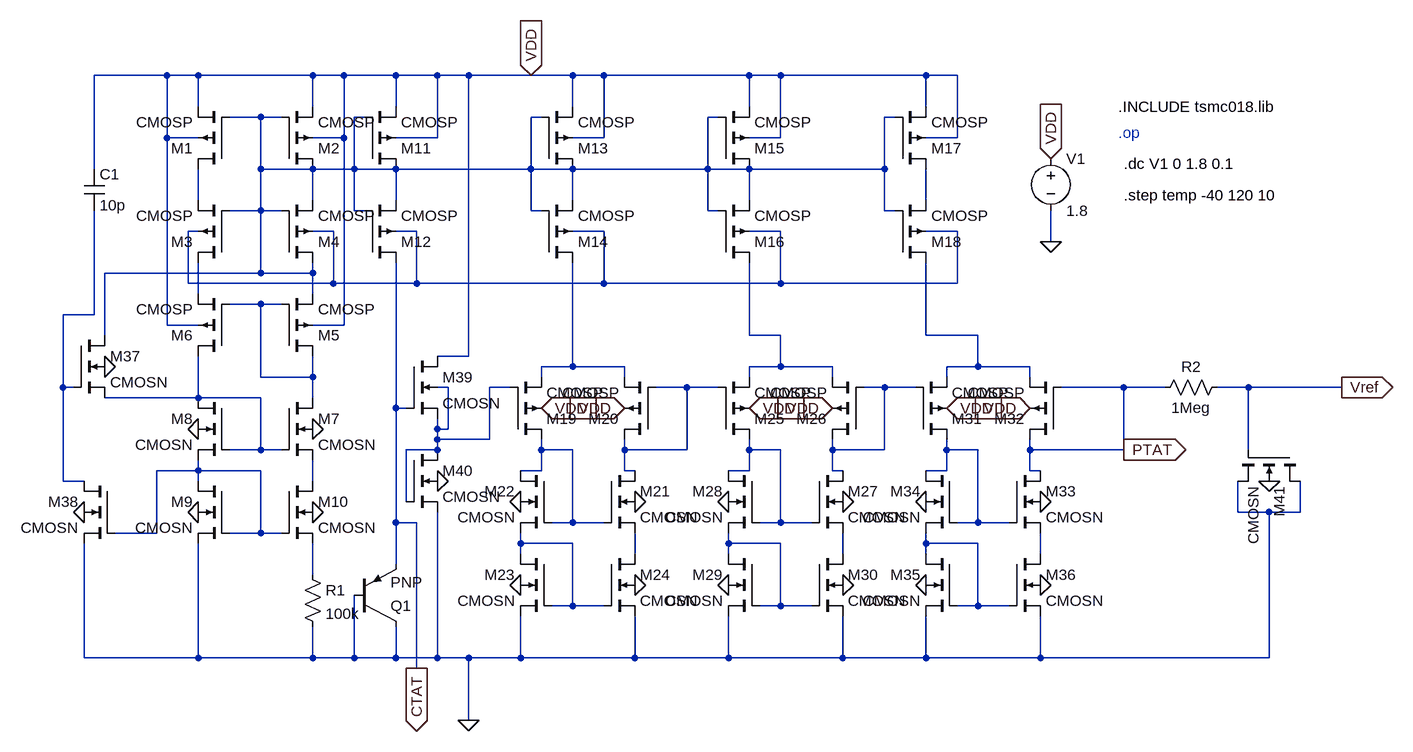
[diagram p0: schematic Bgr_Task2.asc]
Bgr_Task2.asc, the LTspice schematic file:
Version 4.1
SHEET 1 1916 1032
WIRE 0 0 -112 0
WIRE 48 0 0 0
WIRE 224 0 48 0
WIRE 272 0 224 0
WIRE 352 0 272 0
WIRE 416 0 352 0
WIRE 464 0 416 0
WIRE 560 0 464 0
WIRE 624 0 560 0
WIRE 672 0 624 0
WIRE 896 0 672 0
WIRE 944 0 896 0
WIRE 1168 0 944 0
WIRE 1216 0 1168 0
WIRE 48 48 48 0
WIRE 224 48 224 0
WIRE 352 48 352 0
WIRE 624 48 624 0
WIRE 896 48 896 0
WIRE 1168 48 1168 0
WIRE 144 64 96 64
WIRE 176 64 144 64
WIRE 304 64 288 64
WIRE 576 64 560 64
WIRE 848 64 832 64
WIRE 1120 64 1104 64
WIRE 0 96 0 0
WIRE 48 96 0 96
WIRE 272 96 272 0
WIRE 272 96 224 96
WIRE 416 96 416 0
WIRE 416 96 352 96
WIRE 672 96 672 0
WIRE 672 96 624 96
WIRE 944 96 944 0
WIRE 944 96 896 96
WIRE 1216 96 1216 0
WIRE 1216 96 1168 96
WIRE -112 144 -112 0
WIRE 144 144 144 64
WIRE 224 144 144 144
WIRE 288 144 288 64
WIRE 288 144 224 144
WIRE 352 144 288 144
WIRE 560 144 560 64
WIRE 560 144 352 144
WIRE 624 144 560 144
WIRE 832 144 832 64
WIRE 832 144 624 144
WIRE 896 144 832 144
WIRE 1104 144 1104 64
WIRE 1104 144 896 144
WIRE 48 192 48 144
WIRE 224 192 224 144
WIRE 352 192 352 144
WIRE 624 192 624 144
WIRE 896 192 896 144
WIRE 1168 192 1168 144
WIRE 144 208 144 144
WIRE 144 208 96 208
WIRE 176 208 144 208
WIRE 288 208 288 144
WIRE 304 208 288 208
WIRE 560 208 560 144
WIRE 576 208 560 208
WIRE 832 208 832 144
WIRE 848 208 832 208
WIRE 1104 208 1104 144
WIRE 1120 208 1104 208
WIRE 48 240 32 240
WIRE 256 240 224 240
WIRE 384 240 352 240
WIRE 672 240 624 240
WIRE 944 240 896 240
WIRE 1216 240 1168 240
WIRE 1360 256 1360 208
WIRE 144 304 144 208
WIRE 144 304 -96 304
WIRE 224 304 224 288
WIRE 224 304 144 304
WIRE 32 320 32 240
WIRE 256 320 256 240
WIRE 256 320 32 320
WIRE 384 320 384 240
WIRE 384 320 256 320
WIRE 672 320 672 240
WIRE 672 320 384 320
WIRE 944 320 944 240
WIRE 944 320 672 320
WIRE 1216 320 1216 240
WIRE 1216 320 944 320
WIRE 48 336 48 288
WIRE 224 336 224 304
WIRE 144 352 96 352
WIRE 176 352 144 352
WIRE -112 368 -112 208
WIRE -112 368 -160 368
WIRE 0 384 0 96
WIRE 48 384 0 384
WIRE 272 384 272 96
WIRE 272 384 224 384
WIRE -96 400 -96 304
WIRE 896 400 896 288
WIRE 944 400 896 400
WIRE 1168 400 1168 288
WIRE 1248 400 1168 400
WIRE 464 432 464 0
WIRE 464 432 416 432
WIRE 624 448 624 288
WIRE 624 448 576 448
WIRE 704 448 624 448
WIRE 944 448 944 400
WIRE 944 448 896 448
WIRE 1024 448 944 448
WIRE 1248 448 1248 400
WIRE 1248 448 1200 448
WIRE 1328 448 1248 448
WIRE 144 464 144 352
WIRE 224 464 224 432
WIRE 224 464 144 464
WIRE 576 464 576 448
WIRE 704 464 704 448
WIRE 896 464 896 448
WIRE 1024 464 1024 448
WIRE 1200 464 1200 448
WIRE 1328 464 1328 448
WIRE -160 480 -160 368
WIRE -144 480 -160 480
WIRE 432 480 416 480
WIRE 528 480 496 480
WIRE 800 480 752 480
WIRE 848 480 800 480
WIRE 1104 480 1072 480
WIRE 1152 480 1104 480
WIRE 1472 480 1376 480
WIRE 1536 480 1472 480
WIRE 1664 480 1616 480
WIRE 1808 480 1664 480
WIRE 48 496 48 432
WIRE 48 496 -96 496
WIRE 144 496 48 496
WIRE 224 496 224 464
WIRE 352 512 352 288
WIRE 368 512 352 512
WIRE 416 544 416 528
WIRE 432 544 432 480
WIRE 432 544 416 544
WIRE 416 560 416 544
WIRE 496 560 496 480
WIRE 496 560 416 560
WIRE 144 576 144 496
WIRE 144 576 96 576
WIRE 176 576 144 576
WIRE 416 576 416 560
WIRE 416 576 368 576
WIRE 576 576 576 560
WIRE 624 576 576 576
WIRE 704 576 704 560
WIRE 800 576 800 480
WIRE 800 576 704 576
WIRE 896 576 896 560
WIRE 944 576 896 576
WIRE 1024 576 1024 560
WIRE 1104 576 1104 480
WIRE 1104 576 1024 576
WIRE 1200 576 1200 560
WIRE 1248 576 1200 576
WIRE 1328 576 1328 560
WIRE 1472 576 1472 480
WIRE 1472 576 1328 576
WIRE 1664 576 1664 480
WIRE 48 608 48 592
WIRE 48 608 -16 608
WIRE 144 608 48 608
WIRE 576 608 576 576
WIRE 576 608 544 608
WIRE 704 608 704 576
WIRE 720 608 704 608
WIRE 896 608 896 576
WIRE 896 608 864 608
WIRE 1024 608 1024 576
WIRE 1040 608 1024 608
WIRE 1200 608 1200 576
WIRE 1200 608 1168 608
WIRE 1328 608 1328 576
WIRE 1344 608 1328 608
WIRE -160 624 -160 480
WIRE -128 624 -160 624
WIRE 48 624 48 608
WIRE 224 624 224 592
WIRE 368 656 368 576
WIRE 1648 672 1648 624
WIRE 1696 672 1648 672
WIRE 1744 672 1744 624
WIRE 1744 672 1696 672
WIRE 352 688 352 512
WIRE 384 688 352 688
WIRE 624 688 624 576
WIRE 624 688 592 688
WIRE 672 688 624 688
WIRE 944 688 944 576
WIRE 944 688 912 688
WIRE 992 688 944 688
WIRE 1248 688 1248 576
WIRE 1248 688 1216 688
WIRE 1296 688 1248 688
WIRE -16 704 -16 608
WIRE -16 704 -80 704
WIRE 144 704 144 608
WIRE 144 704 96 704
WIRE 176 704 144 704
WIRE 544 720 544 704
WIRE 624 720 544 720
WIRE 864 720 864 704
WIRE 944 720 864 720
WIRE 1168 720 1168 704
WIRE 1248 720 1168 720
WIRE 544 736 544 720
WIRE 720 736 720 704
WIRE 864 736 864 720
WIRE 1040 736 1040 704
WIRE 1168 736 1168 720
WIRE 1344 736 1344 704
WIRE 352 752 352 688
WIRE 224 768 224 720
WIRE 624 816 624 720
WIRE 624 816 592 816
WIRE 672 816 624 816
WIRE 944 816 944 720
WIRE 944 816 912 816
WIRE 992 816 944 816
WIRE 1248 816 1248 720
WIRE 1248 816 1216 816
WIRE 1296 816 1248 816
WIRE -128 896 -128 720
WIRE 48 896 48 720
WIRE 48 896 -128 896
WIRE 224 896 224 848
WIRE 224 896 48 896
WIRE 288 896 288 800
WIRE 288 896 224 896
WIRE 352 896 352 848
WIRE 352 896 288 896
WIRE 416 896 416 672
WIRE 416 896 352 896
WIRE 464 896 416 896
WIRE 544 896 544 832
WIRE 544 896 464 896
WIRE 720 896 720 832
WIRE 720 896 544 896
WIRE 864 896 864 832
WIRE 864 896 720 896
WIRE 1040 896 1040 832
WIRE 1040 896 864 896
WIRE 1168 896 1168 832
WIRE 1168 896 1040 896
WIRE 1344 896 1344 832
WIRE 1344 896 1168 896
WIRE 1696 896 1696 672
WIRE 1696 896 1344 896
WIRE 384 912 384 688
WIRE 464 992 464 896
FLAG 1360 256 0
FLAG 1360 128 VDD
IOPIN 1360 128 In
FLAG 464 992 0
FLAG 560 0 VDD
IOPIN 560 0 In
FLAG 1808 480 Vref
IOPIN 1808 480 Out
FLAG 576 512 VDD
IOPIN 576 512 In
FLAG 704 512 VDD
IOPIN 704 512 In
FLAG 896 512 VDD
IOPIN 896 512 In
FLAG 1024 512 VDD
IOPIN 1024 512 In
FLAG 1200 512 VDD
IOPIN 1200 512 In
FLAG 1328 512 VDD
IOPIN 1328 512 In
FLAG 416 624 0
FLAG 544 656 0
FLAG 720 656 0
FLAG 544 784 0
FLAG 720 784 0
FLAG 864 784 0
FLAG 864 656 0
FLAG 1040 656 0
FLAG 1040 784 0
FLAG 1168 656 0
FLAG 1344 656 0
FLAG 1344 784 0
FLAG 1168 784 0
FLAG 48 672 0
FLAG 48 544 0
FLAG 224 544 0
FLAG 224 672 0
FLAG -128 672 0
FLAG -96 448 0
FLAG 1696 624 0
FLAG 384 912 CTAT
IOPIN 384 912 Out
FLAG 1472 576 PTAT
IOPIN 1472 576 Out
DATAFLAG 384 752 ""
SYMBOL cmosp 96 144 R180
SYMATTR InstName M1
SYMATTR Value2 l=4u w=8u
SYMBOL cmosp 176 144 M180
SYMATTR InstName M2
SYMATTR Value2 l=4u w=8u
SYMBOL cmosp 96 288 R180
SYMATTR InstName M3
SYMATTR Value2 l=4u w=8u
SYMBOL cmosp 176 288 M180
SYMATTR InstName M4
SYMATTR Value2 l=4u w=8u
SYMBOL cmosp 176 432 M180
SYMATTR InstName M5
SYMATTR Value2 l=4u w=8u
SYMBOL cmosp 96 432 R180
SYMATTR InstName M6
SYMATTR Value2 l=4u w=8u
SYMBOL cmosn 176 496 R0
SYMATTR InstName M7
SYMATTR Value2 l=4u w=4u
SYMBOL cmosn 96 496 M0
SYMATTR InstName M8
SYMATTR Value2 l=4u w=4u
SYMBOL cmosn 96 624 M0
SYMATTR InstName M9
SYMATTR Value2 l=4u w=4u
SYMBOL cmosn 176 624 R0
SYMATTR InstName M10
SYMATTR Value2 l=4u w=4u
SYMBOL voltage 1360 112 R0
WINDOW 123 0 0 Left 0
WINDOW 39 0 0 Left 0
SYMATTR InstName V1
SYMATTR Value 1.8
SYMBOL cmosp 304 144 M180
SYMATTR InstName M11
SYMATTR Value2 l=2u w=20u
SYMBOL cmosp 304 288 M180
SYMATTR InstName M12
SYMATTR Value2 l=2u w=20u
SYMBOL cmosp 576 144 M180
SYMATTR InstName M13
SYMATTR Value2 l=2u w=20u
SYMBOL cmosp 576 288 M180
SYMATTR InstName M14
SYMATTR Value2 l=2u w=20u
SYMBOL cmosp 848 144 M180
SYMATTR InstName M15
SYMATTR Value2 l=2u w=20u
SYMBOL cmosp 848 288 M180
SYMATTR InstName M16
SYMATTR Value2 l=2u w=20u
SYMBOL cmosp 1120 144 M180
SYMATTR InstName M17
SYMATTR Value2 l=2u w=20u
SYMBOL cmosp 1120 288 M180
SYMATTR InstName M18
SYMATTR Value2 l=2u w=20u
SYMBOL cmosp 528 560 M180
SYMATTR InstName M19
SYMATTR Value2 l=2u w=1u
SYMBOL cmosp 752 560 R180
SYMATTR InstName M20
SYMATTR Value2 l=2u w=40u
SYMBOL cmosn 672 608 R0
SYMATTR InstName M21
SYMATTR Value2 l=2u w=10u
SYMBOL cmosn 592 608 M0
SYMATTR InstName M22
SYMATTR Value2 l=2u w=10u
SYMBOL cmosn 592 736 M0
SYMATTR InstName M23
SYMATTR Value2 l=2u w=10u
SYMBOL cmosn 672 736 R0
SYMATTR InstName M24
SYMATTR Value2 l=2u w=10u
SYMBOL cmosn -144 400 R0
SYMATTR InstName M37
SYMATTR Value2 l=2u w=4u
SYMBOL cmosn -80 624 M0
SYMATTR InstName M38
SYMATTR Value2 l=2u w=4u
SYMBOL cap -128 144 R0
SYMATTR InstName C1
SYMATTR Value 10p
SYMBOL res 208 752 R0
SYMATTR InstName R1
SYMATTR Value 100k
SYMBOL pnp 288 848 M180
SYMATTR InstName Q1
SYMBOL cmosn 368 432 R0
SYMATTR InstName M39
SYMATTR Value2 l=2u w=10u
SYMBOL cmosn 368 576 R0
SYMATTR InstName M40
SYMATTR Value2 l=2u w=10u
SYMBOL cmosp 848 560 M180
SYMATTR InstName M25
SYMATTR Value2 l=2u w=1u
SYMBOL cmosp 1072 560 R180
SYMATTR InstName M26
SYMATTR Value2 l=2u w=40u
SYMBOL cmosn 992 608 R0
SYMATTR InstName M27
SYMATTR Value2 l=2u w=4u
SYMBOL cmosn 912 608 M0
SYMATTR InstName M28
SYMATTR Value2 l=2u w=4u
SYMBOL cmosn 912 736 M0
SYMATTR InstName M29
SYMATTR Value2 l=2u w=4u
SYMBOL cmosn 992 736 R0
SYMATTR InstName M30
SYMATTR Value2 l=2u w=4u
SYMBOL cmosp 1152 560 M180
SYMATTR InstName M31
SYMATTR Value2 l=2u w=1u
SYMBOL cmosp 1376 560 R180
SYMATTR InstName M32
SYMATTR Value2 l=2u w=40u
SYMBOL cmosn 1296 608 R0
SYMATTR InstName M33
SYMATTR Value2 l=2u w=4u
SYMBOL cmosn 1216 608 M0
SYMATTR InstName M34
SYMATTR Value2 l=2u w=4u
SYMBOL cmosn 1216 736 M0
SYMATTR InstName M35
SYMATTR Value2 l=2u w=4u
SYMBOL cmosn 1296 736 R0
SYMATTR InstName M36
SYMATTR Value2 l=2u w=4u
SYMBOL res 1632 464 R90
WINDOW 0 0 56 VBottom 2
WINDOW 3 32 56 VTop 2
SYMATTR InstName R2
SYMATTR Value 1Meg
SYMBOL cmosn 1744 576 R90
SYMATTR InstName M41
SYMATTR Value2 l=2u w=4u
TEXT 1464 48 Left 2 !.INCLUDE tsmc018.lib
TEXT 1464 88 Left 2 ;.op
TEXT 1472 136 Left 2 !.dc V1 0 1.8 0.1
TEXT 1472 184 Left 2 !.step temp -40 120 10

The netlist it stands for:
* Bgr_Task2.asc
M1 N002 N001 VDD VDD CMOSP l=4u w=8u
M2 N001 N001 VDD VDD CMOSP l=4u w=8u
M3 N005 N001 N002 N004 CMOSP l=4u w=8u
M4 N001 N001 N001 N004 CMOSP l=4u w=8u
M5 N006 N006 N001 VDD CMOSP l=4u w=8u
M6 N014 N006 N005 VDD CMOSP l=4u w=8u
M7 N006 N014 N019 0 CMOSN l=4u w=4u
M8 N014 N014 N018 0 CMOSN l=4u w=4u
M9 N018 N018 0 0 CMOSN l=4u w=4u
M10 N019 N018 N026 0 CMOSN l=4u w=4u
V1 VDD 0 1.8
M11 N001 N001 VDD VDD CMOSP l=2u w=20u
M12 CTAT N001 N001 N004 CMOSP l=2u w=20u
M13 N001 N001 VDD VDD CMOSP l=2u w=20u
M14 N010 N001 N001 N004 CMOSP l=2u w=20u
M15 N001 N001 VDD VDD CMOSP l=2u w=20u
M16 N008 N001 N001 N004 CMOSP l=2u w=20u
M17 N003 N001 VDD VDD CMOSP l=2u w=20u
M18 N009 N001 N003 N004 CMOSP l=2u w=20u
M19 N015 N011 N010 VDD CMOSP l=2u w=1u
M20 N012 N012 N010 VDD CMOSP l=2u w=40u
M21 N012 N015 N023 0 CMOSN l=2u w=10u
M22 N015 N015 N020 0 CMOSN l=2u w=10u
M23 N020 N020 0 0 CMOSN l=2u w=10u
M24 N023 N020 0 0 CMOSN l=2u w=10u
M37 N001 N007 N014 0 CMOSN l=2u w=4u
M38 N007 N018 0 0 CMOSN l=2u w=4u
C1 VDD N007 10p
R1 N026 0 100k
Q1 0 0 CTAT 0 PNP
M39 VDD CTAT N011 N011 CMOSN l=2u w=10u
M40 N011 N011 0 0 CMOSN l=2u w=10u
M25 N016 N012 N008 VDD CMOSP l=2u w=1u
M26 N013 N013 N008 VDD CMOSP l=2u w=40u
M27 N013 N016 N024 0 CMOSN l=2u w=4u
M28 N016 N016 N021 0 CMOSN l=2u w=4u
M29 N021 N021 0 0 CMOSN l=2u w=4u
M30 N024 N021 0 0 CMOSN l=2u w=4u
M31 N017 N013 N009 VDD CMOSP l=2u w=1u
M32 PTAT PTAT N009 VDD CMOSP l=2u w=40u
M33 PTAT N017 N025 0 CMOSN l=2u w=4u
M34 N017 N017 N022 0 CMOSN l=2u w=4u
M35 N022 N022 0 0 CMOSN l=2u w=4u
M36 N025 N022 0 0 CMOSN l=2u w=4u
R2 Vref PTAT 1Meg
M41 0 Vref 0 0 CMOSN l=2u w=4u
.model NPN NPN
.model PNP PNP
.lib standard.bjt
.model NMOS NMOS
.model PMOS PMOS
.lib standard.mos
.INCLUDE tsmc018.lib
* .op
.dc V1 0 1.8 0.1
.step temp -40 120 10
.backanno
.end